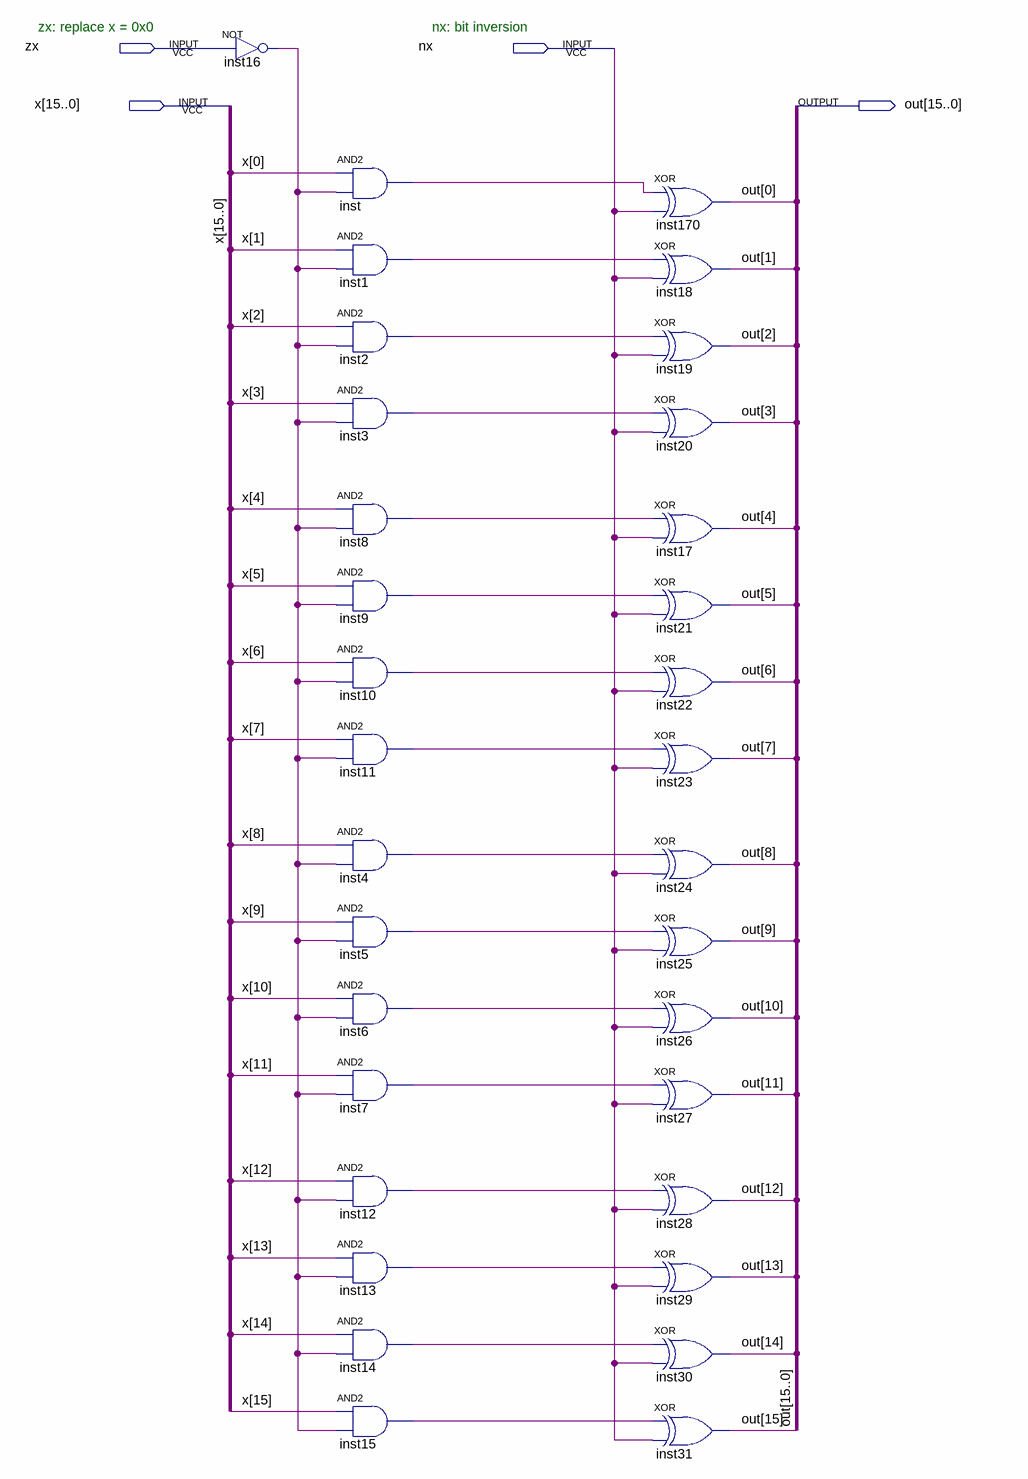
[diagram p0: schematic sheet]
// Quartus schematic alu_bitmanipulate.bdf as structural Verilog: 33 symbols, 4 pins
module alu_bitmanipulate (
  input  zx,
  input  nx,
  input  [15:0] x,
  output [15:0] out
);

  wire inst1_out, inst2_out, inst3_out, inst4_out, inst5_out, inst6_out, inst7_out, inst8_out, inst9_out,
       inst10_out, inst11_out, inst12_out, inst13_out, inst14_out, inst15_out, inst16_out, inst_out;

  not inst16 (inst16_out, zx);
  and inst (inst_out, x[0], inst16_out);
  and inst1 (inst1_out, x[1], inst16_out);
  and inst2 (inst2_out, x[2], inst16_out);
  and inst3 (inst3_out, x[3], inst16_out);
  and inst8 (inst8_out, x[4], inst16_out);
  and inst9 (inst9_out, x[5], inst16_out);
  and inst10 (inst10_out, x[6], inst16_out);
  and inst11 (inst11_out, x[7], inst16_out);
  and inst4 (inst4_out, x[8], inst16_out);
  and inst5 (inst5_out, x[9], inst16_out);
  and inst6 (inst6_out, x[10], inst16_out);
  and inst7 (inst7_out, x[11], inst16_out);
  and inst12 (inst12_out, x[12], inst16_out);
  and inst13 (inst13_out, x[13], inst16_out);
  and inst14 (inst14_out, x[14], inst16_out);
  and inst15 (inst15_out, x[15], inst16_out);
  xor inst170 (out[0], inst_out, nx);
  xor inst18 (out[1], inst1_out, nx);
  xor inst19 (out[2], inst2_out, nx);
  xor inst20 (out[3], inst3_out, nx);
  xor inst17 (out[4], inst8_out, nx);
  xor inst21 (out[5], inst9_out, nx);
  xor inst22 (out[6], inst10_out, nx);
  xor inst23 (out[7], inst11_out, nx);
  xor inst24 (out[8], inst4_out, nx);
  xor inst25 (out[9], inst5_out, nx);
  xor inst26 (out[10], inst6_out, nx);
  xor inst27 (out[11], inst7_out, nx);
  xor inst28 (out[12], inst12_out, nx);
  xor inst29 (out[13], inst13_out, nx);
  xor inst30 (out[14], inst14_out, nx);
  xor inst31 (out[15], inst15_out, nx);

  // Notes on the sheet:
  //   zx: replace x = 0x0
  //   nx: bit inversion
endmodule
